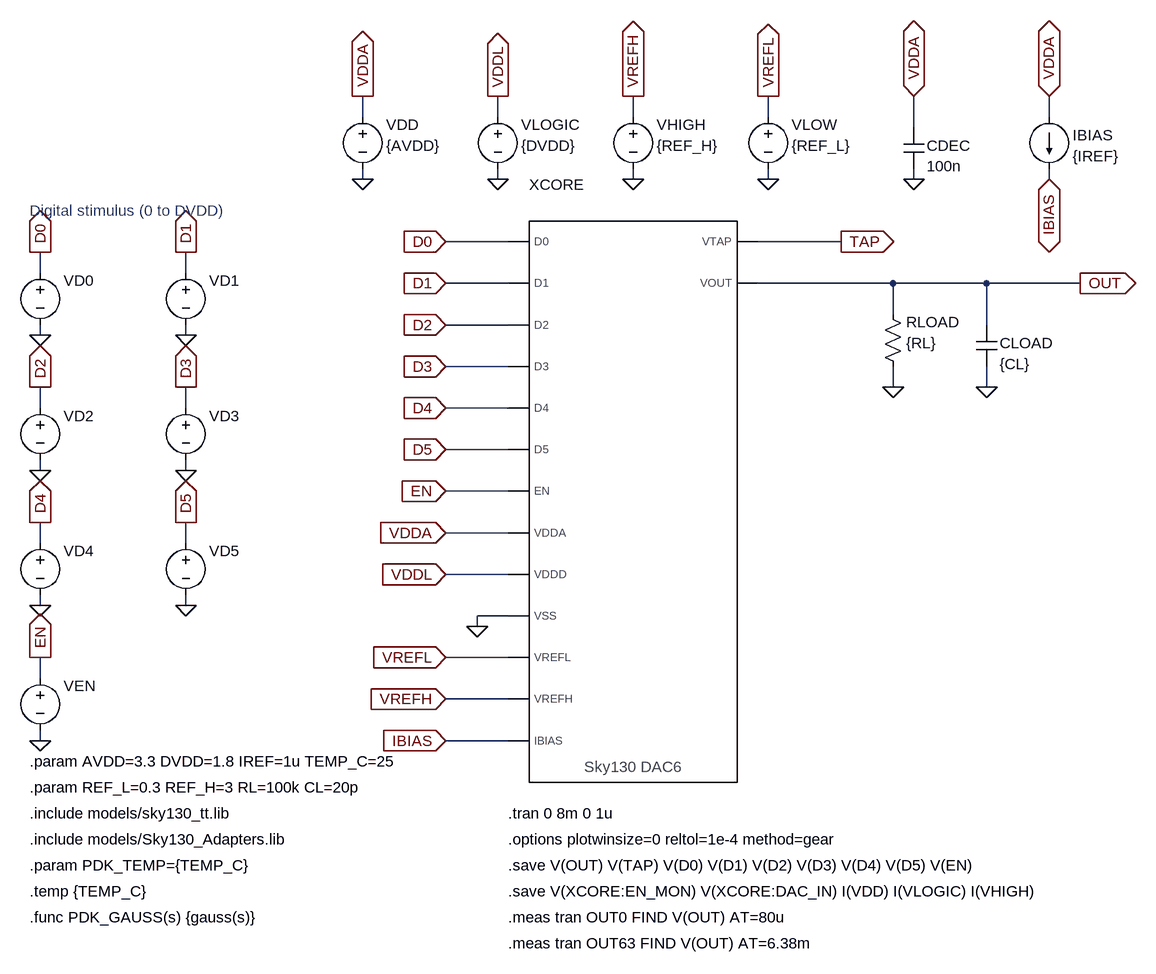
[diagram p0: schematic DAC6_Sky130_Top.asc]
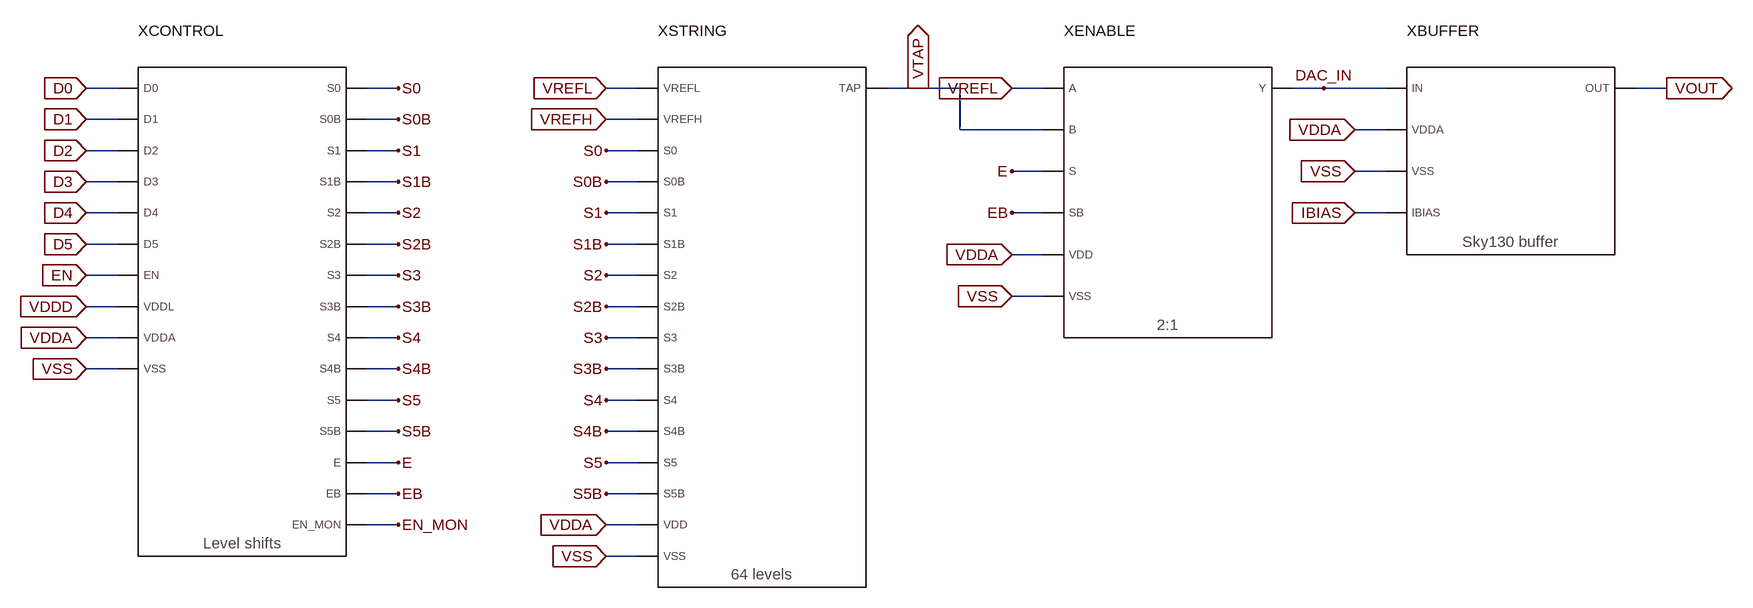
[diagram p1: sub-circuit dac6_sky130_core.asc]
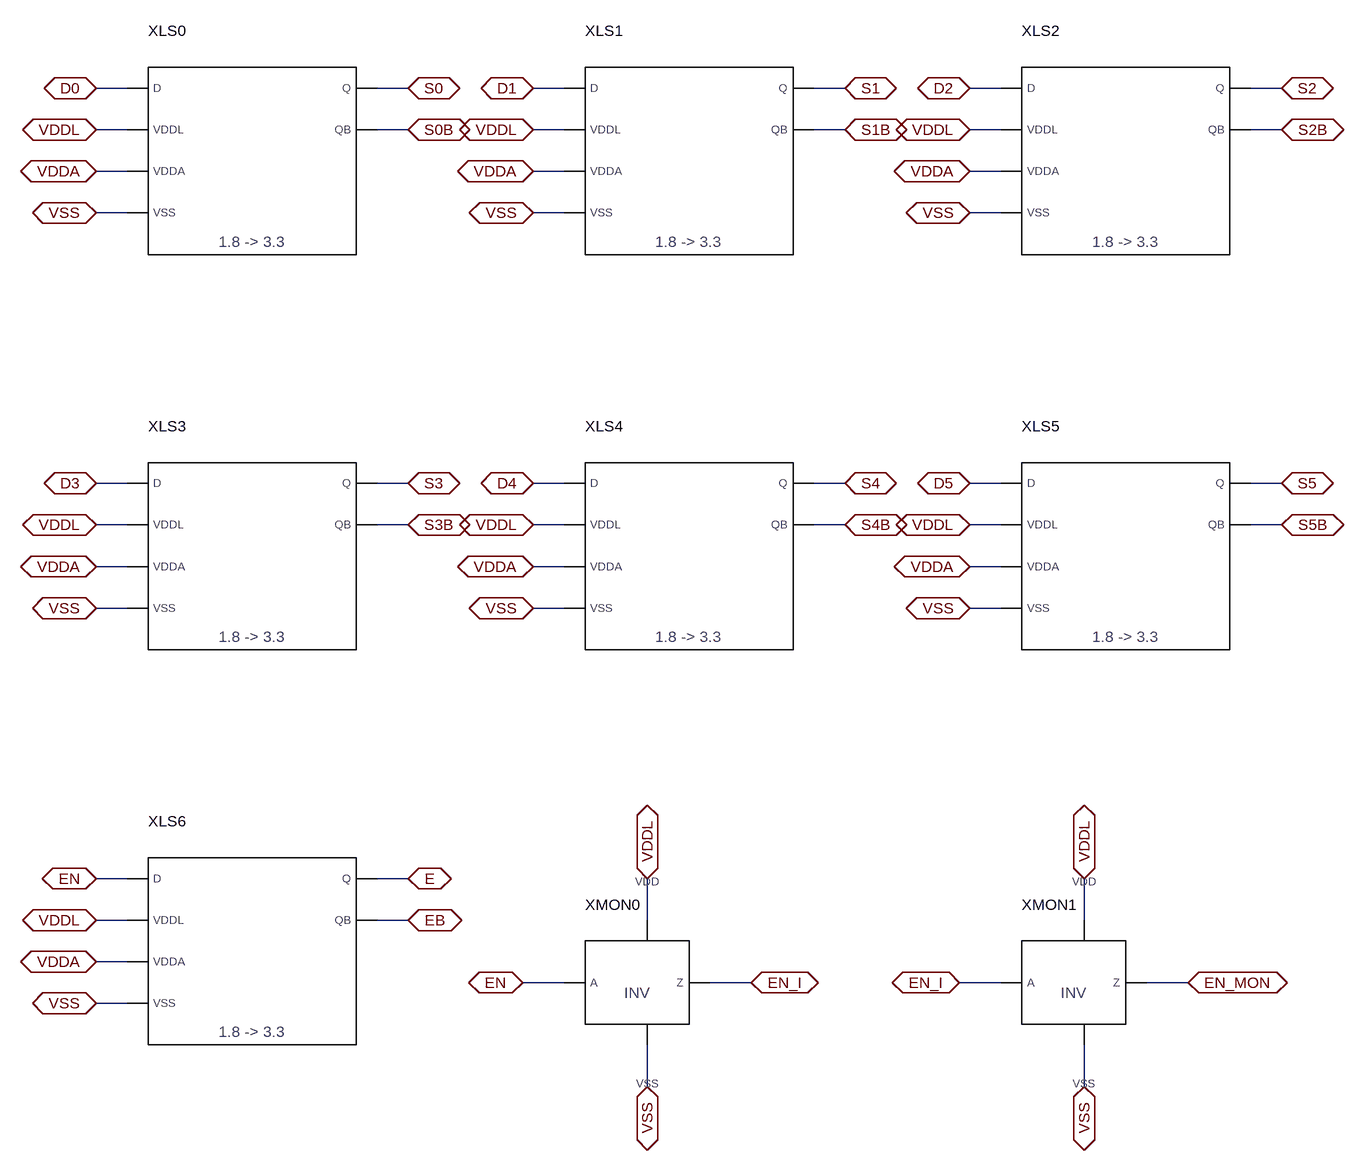
[diagram p2: sub-circuit dac_control.asc]
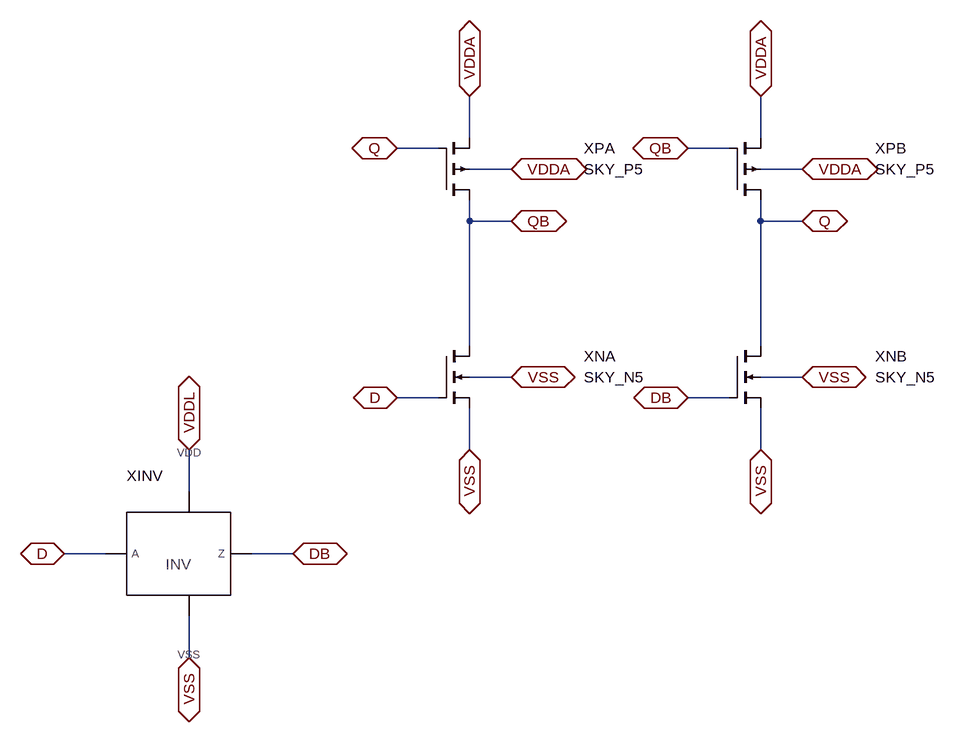
[diagram p3: sub-circuit dac_levelshift.asc]
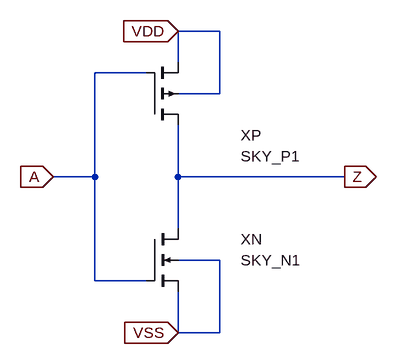
[diagram p4: sub-circuit cmos_inv.asc]
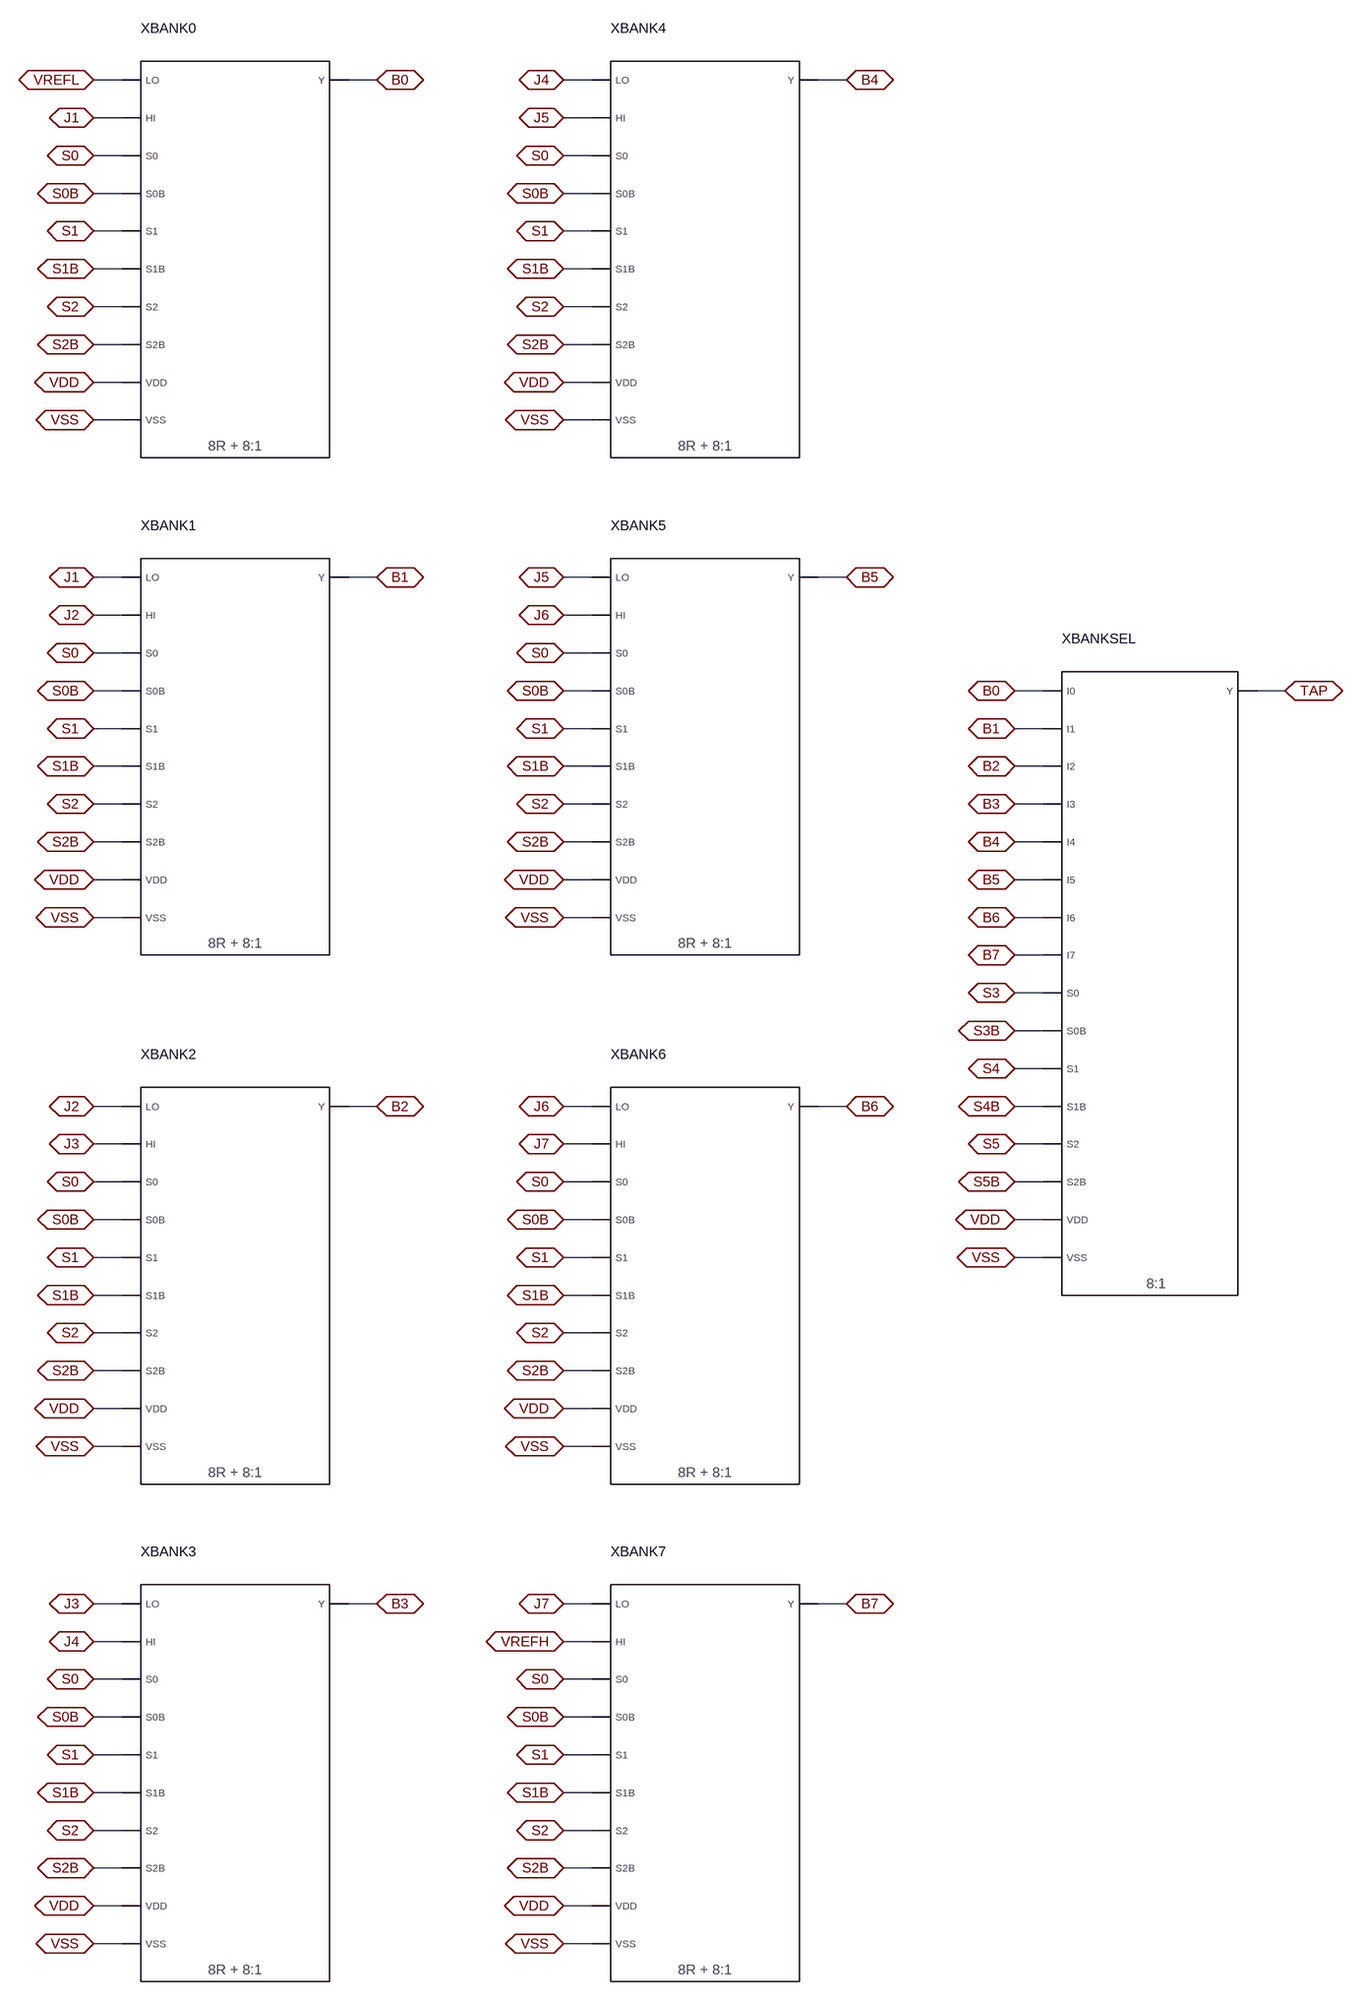
[diagram p5: sub-circuit dac_string64.asc]
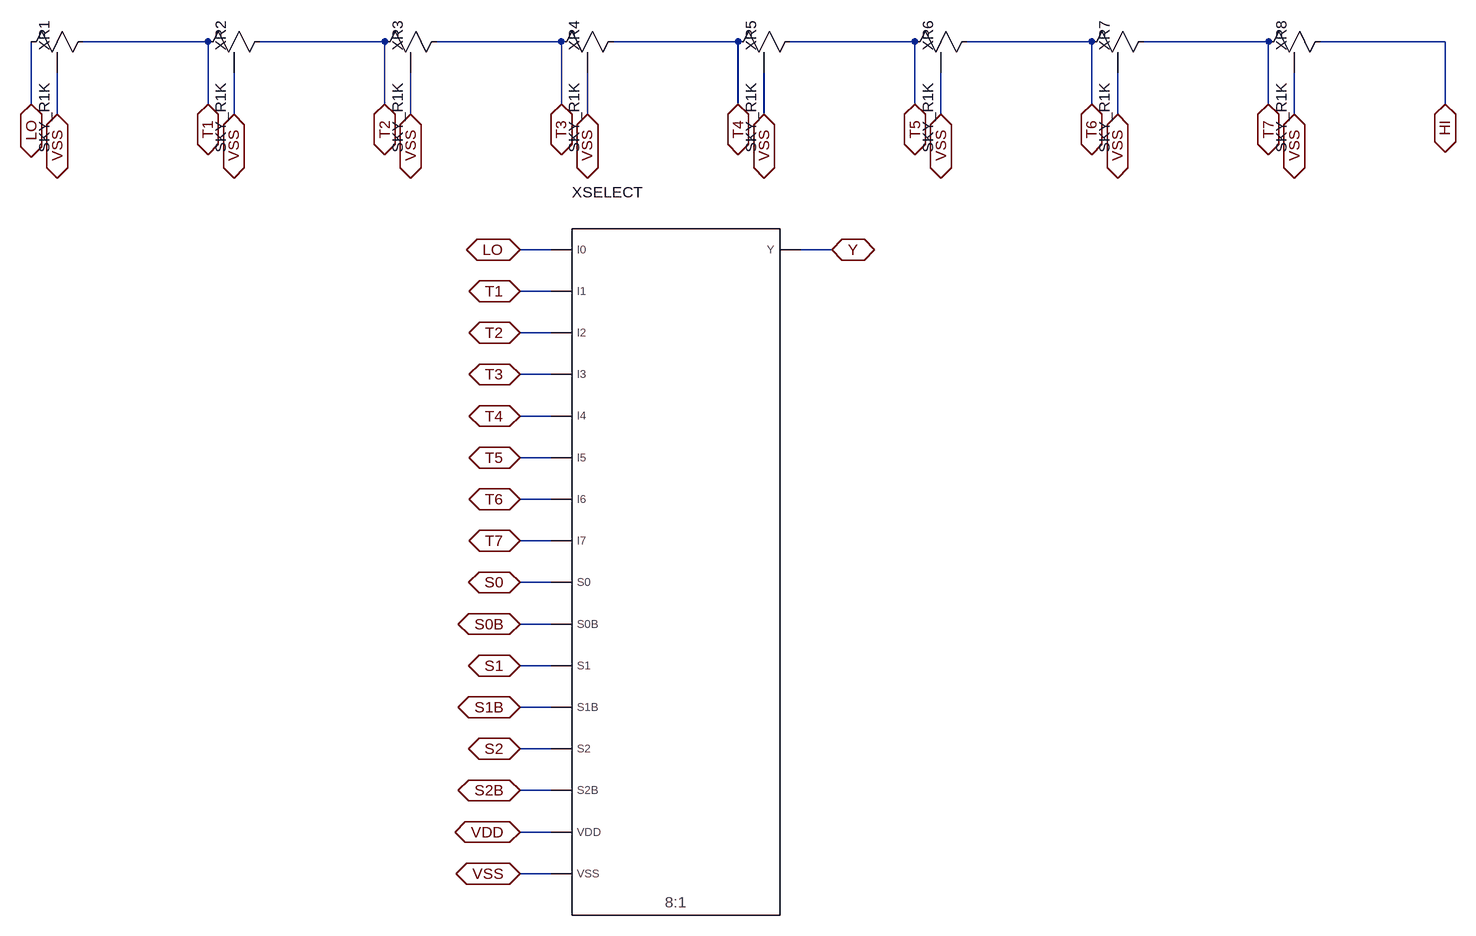
[diagram p6: sub-circuit dac_bank8.asc]
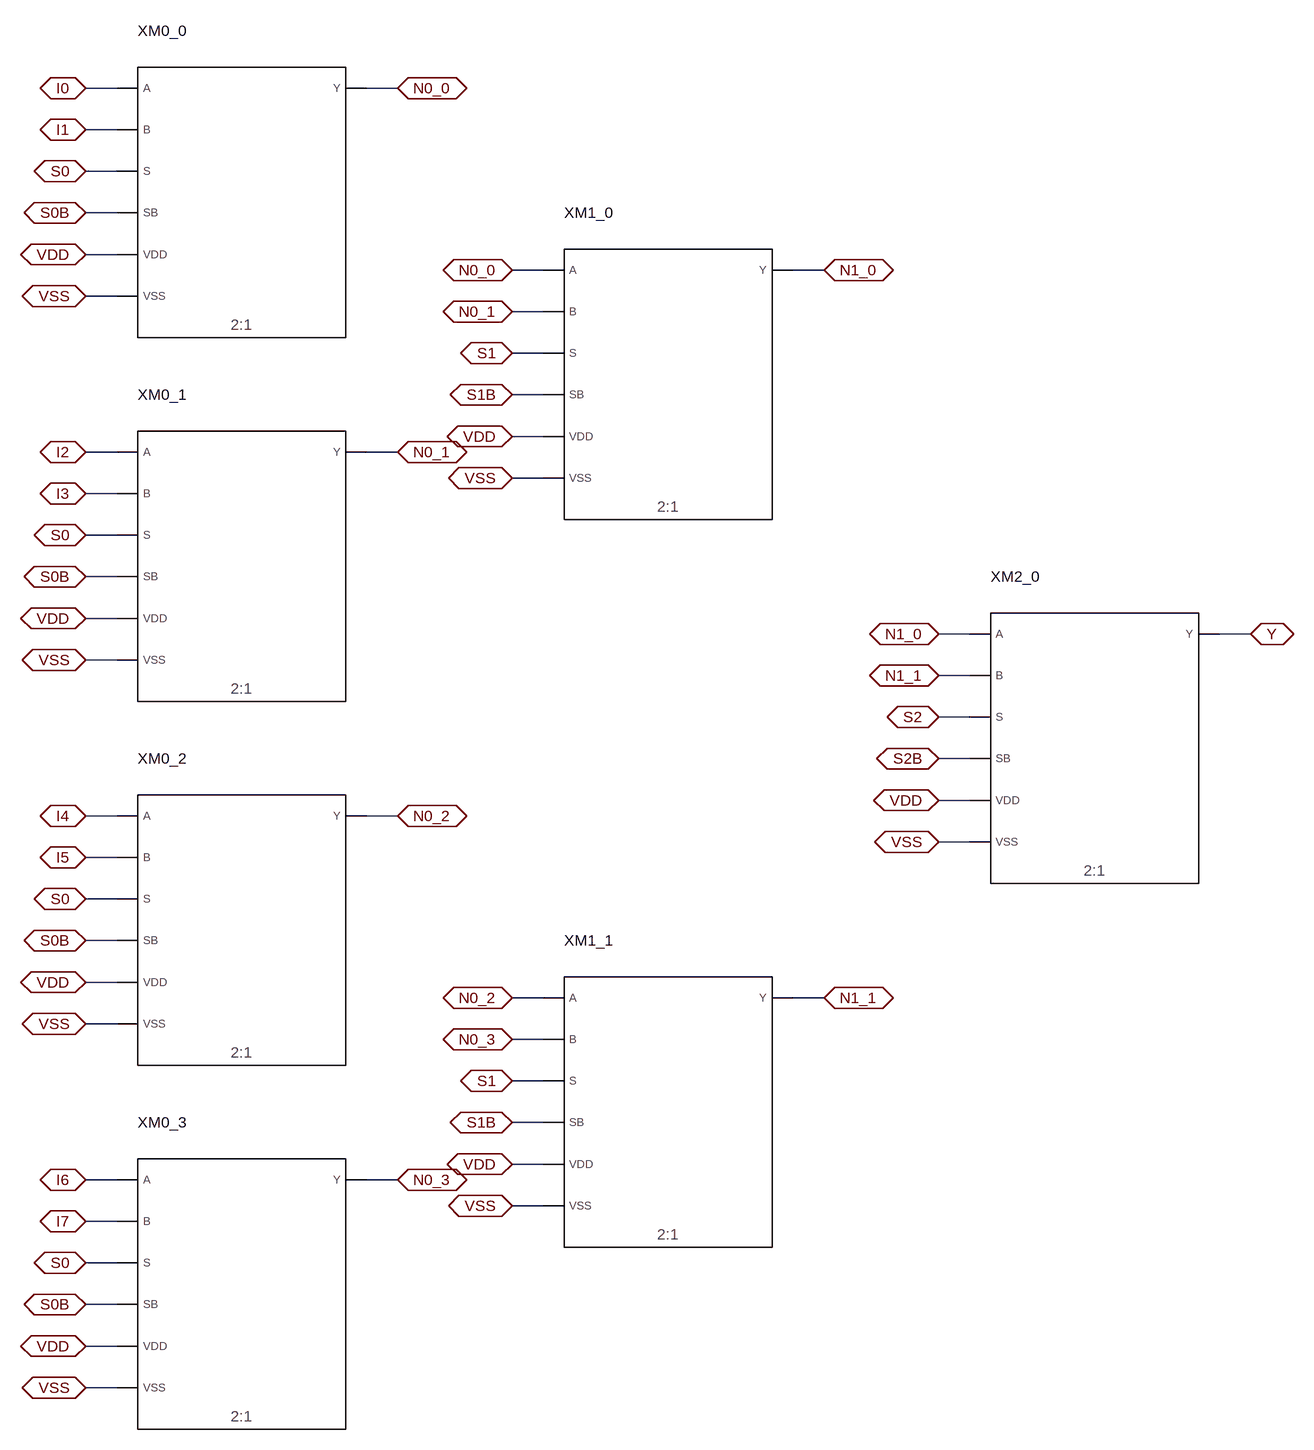
[diagram p7: sub-circuit dac_mux8.asc]
DAC6_Sky130_Top.asc, the LTspice schematic file:
Version 4.1
SHEET 1 1920 1472
WIRE 592 96 592 64
WIRE 592 192 592 176
WIRE 800 96 800 64
WIRE 800 192 800 176
WIRE 1008 96 1008 64
WIRE 1008 192 1008 176
WIRE 1216 96 1216 64
WIRE 1216 192 1216 176
WIRE 1440 112 1440 64
WIRE 1440 192 1440 176
WIRE 1648 96 1648 64
WIRE 1648 192 1648 176
WIRE 96 336 96 304
WIRE 96 432 96 416
WIRE 320 336 320 304
WIRE 320 432 320 416
WIRE 96 544 96 512
WIRE 96 640 96 624
WIRE 320 544 320 512
WIRE 320 640 320 624
WIRE 96 752 96 720
WIRE 96 848 96 832
WIRE 320 752 320 720
WIRE 320 848 320 832
WIRE 96 960 96 928
WIRE 96 1056 96 1040
WIRE 816 288 720 288
WIRE 816 352 720 352
WIRE 816 416 720 416
WIRE 816 480 720 480
WIRE 816 544 720 544
WIRE 816 608 720 608
WIRE 816 672 720 672
WIRE 816 736 720 736
WIRE 816 800 720 800
WIRE 816 864 768 864
WIRE 768 880 768 864
WIRE 816 928 720 928
WIRE 816 992 720 992
WIRE 816 1056 720 1056
WIRE 1328 288 1200 288
WIRE 1408 352 1200 352
WIRE 1552 352 1408 352
WIRE 1696 352 1552 352
WIRE 1408 400 1408 352
WIRE 1408 512 1408 480
WIRE 1552 416 1552 352
WIRE 1552 512 1552 480
FLAG 592 64 VDDA
IOPIN 592 64 Out
FLAG 592 192 0
FLAG 800 64 VDDL
IOPIN 800 64 Out
FLAG 800 192 0
FLAG 1008 64 VREFH
IOPIN 1008 64 Out
FLAG 1008 192 0
FLAG 1216 64 VREFL
IOPIN 1216 64 Out
FLAG 1216 192 0
FLAG 1440 64 VDDA
IOPIN 1440 64 BiDir
FLAG 1440 192 0
FLAG 1648 64 VDDA
IOPIN 1648 64 BiDir
FLAG 1648 192 IBIAS
IOPIN 1648 192 BiDir
FLAG 96 304 D0
IOPIN 96 304 Out
FLAG 96 432 0
FLAG 320 304 D1
IOPIN 320 304 Out
FLAG 320 432 0
FLAG 96 512 D2
IOPIN 96 512 Out
FLAG 96 640 0
FLAG 320 512 D3
IOPIN 320 512 Out
FLAG 320 640 0
FLAG 96 720 D4
IOPIN 96 720 Out
FLAG 96 848 0
FLAG 320 720 D5
IOPIN 320 720 Out
FLAG 320 848 0
FLAG 96 928 EN
IOPIN 96 928 Out
FLAG 96 1056 0
FLAG 720 288 D0
IOPIN 720 288 In
FLAG 720 352 D1
IOPIN 720 352 In
FLAG 720 416 D2
IOPIN 720 416 In
FLAG 720 480 D3
IOPIN 720 480 In
FLAG 720 544 D4
IOPIN 720 544 In
FLAG 720 608 D5
IOPIN 720 608 In
FLAG 720 672 EN
IOPIN 720 672 In
FLAG 720 736 VDDA
IOPIN 720 736 In
FLAG 720 800 VDDL
IOPIN 720 800 In
FLAG 768 880 0
FLAG 720 928 VREFL
IOPIN 720 928 In
FLAG 720 992 VREFH
IOPIN 720 992 In
FLAG 720 1056 IBIAS
IOPIN 720 1056 In
FLAG 1328 288 TAP
IOPIN 1328 288 Out
FLAG 1696 352 OUT
IOPIN 1696 352 Out
FLAG 1408 512 0
FLAG 1552 512 0
SYMBOL voltage 592 80 R0
WINDOW 0 36 28 Left 2
WINDOW 3 36 60 Left 2
SYMATTR InstName VDD
SYMATTR Value {AVDD}
SYMBOL voltage 800 80 R0
WINDOW 0 36 28 Left 2
WINDOW 3 36 60 Left 2
SYMATTR InstName VLOGIC
SYMATTR Value {DVDD}
SYMBOL voltage 1008 80 R0
WINDOW 0 36 28 Left 2
WINDOW 3 36 60 Left 2
SYMATTR InstName VHIGH
SYMATTR Value {REF_H}
SYMBOL voltage 1216 80 R0
WINDOW 0 36 28 Left 2
WINDOW 3 36 60 Left 2
SYMATTR InstName VLOW
SYMATTR Value {REF_L}
SYMBOL cap 1424 112 R0
WINDOW 0 36 28 Left 2
WINDOW 3 36 60 Left 2
SYMATTR InstName CDEC
SYMATTR Value 100n
SYMBOL current 1648 96 R0
WINDOW 0 36 28 Left 2
WINDOW 3 36 60 Left 2
SYMATTR InstName IBIAS
SYMATTR Value {IREF}
SYMBOL voltage 96 320 R0
WINDOW 0 36 28 Left 2
WINDOW 3 0 0 Invisible 0
SYMATTR InstName VD0
SYMATTR Value PWL VALUE_SCALE_FACTOR={DVDD} FILE="stimulus/d0.txt"
SYMBOL voltage 320 320 R0
WINDOW 0 36 28 Left 2
WINDOW 3 0 0 Invisible 0
SYMATTR InstName VD1
SYMATTR Value PWL VALUE_SCALE_FACTOR={DVDD} FILE="stimulus/d1.txt"
SYMBOL voltage 96 528 R0
WINDOW 0 36 28 Left 2
WINDOW 3 0 0 Invisible 0
SYMATTR InstName VD2
SYMATTR Value PWL VALUE_SCALE_FACTOR={DVDD} FILE="stimulus/d2.txt"
SYMBOL voltage 320 528 R0
WINDOW 0 36 28 Left 2
WINDOW 3 0 0 Invisible 0
SYMATTR InstName VD3
SYMATTR Value PWL VALUE_SCALE_FACTOR={DVDD} FILE="stimulus/d3.txt"
SYMBOL voltage 96 736 R0
WINDOW 0 36 28 Left 2
WINDOW 3 0 0 Invisible 0
SYMATTR InstName VD4
SYMATTR Value PWL VALUE_SCALE_FACTOR={DVDD} FILE="stimulus/d4.txt"
SYMBOL voltage 320 736 R0
WINDOW 0 36 28 Left 2
WINDOW 3 0 0 Invisible 0
SYMATTR InstName VD5
SYMATTR Value PWL VALUE_SCALE_FACTOR={DVDD} FILE="stimulus/d5.txt"
SYMBOL voltage 96 944 R0
WINDOW 0 36 28 Left 2
WINDOW 3 0 0 Invisible 0
SYMATTR InstName VEN
SYMATTR Value PWL VALUE_SCALE_FACTOR={DVDD} FILE="stimulus/enable.txt"
SYMBOL blocks\\DAC6_Sky130_Core 816 224 R0
SYMATTR InstName XCORE
SYMBOL res 1392 384 R0
WINDOW 0 36 28 Left 2
WINDOW 3 36 60 Left 2
SYMATTR InstName RLOAD
SYMATTR Value {RL}
SYMBOL cap 1536 416 R0
WINDOW 0 36 28 Left 2
WINDOW 3 36 60 Left 2
SYMATTR InstName CLOAD
SYMATTR Value {CL}
TEXT 80 240 Left 2 ;Digital stimulus (0 to DVDD)
TEXT 80 1088 Left 2 !.param AVDD=3.3 DVDD=1.8 IREF=1u TEMP_C=25
TEXT 80 1128 Left 2 !.param REF_L=0.3 REF_H=3 RL=100k CL=20p
TEXT 80 1168 Left 2 !.include models/sky130_tt.lib
TEXT 80 1208 Left 2 !.include models/Sky130_Adapters.lib
TEXT 80 1248 Left 2 !.param PDK_TEMP={TEMP_C}
TEXT 80 1288 Left 2 !.temp {TEMP_C}
TEXT 80 1328 Left 2 !.func PDK_GAUSS(s) {gauss(s)}
TEXT 816 1168 Left 2 !.tran 0 8m 0 1u
TEXT 816 1208 Left 2 !.options plotwinsize=0 reltol=1e-4 method=gear
TEXT 816 1248 Left 2 !.save V(OUT) V(TAP) V(D0) V(D1) V(D2) V(D3) V(D4) V(D5) V(EN)
TEXT 816 1288 Left 2 !.save V(XCORE:EN_MON) V(XCORE:DAC_IN) I(VDD) I(VLOGIC) I(VHIGH)
TEXT 816 1328 Left 2 !.meas tran OUT0 FIND V(OUT) AT=80u
TEXT 816 1368 Left 2 !.meas tran OUT63 FIND V(OUT) AT=6.38m

The netlist it stands for:
* DAC6_Sky130_Top.asc
VDD VDDA 0 {AVDD}
VLOGIC VDDL 0 {DVDD}
VHIGH VREFH 0 {REF_H}
VLOW VREFL 0 {REF_L}
CDEC VDDA 0 100n
IBIAS VDDA IBIAS {IREF}
VD0 D0 0 PWL VALUE_SCALE_FACTOR={DVDD} FILE="stimulus/d0.txt"
VD1 D1 0 PWL VALUE_SCALE_FACTOR={DVDD} FILE="stimulus/d1.txt"
VD2 D2 0 PWL VALUE_SCALE_FACTOR={DVDD} FILE="stimulus/d2.txt"
VD3 D3 0 PWL VALUE_SCALE_FACTOR={DVDD} FILE="stimulus/d3.txt"
VD4 D4 0 PWL VALUE_SCALE_FACTOR={DVDD} FILE="stimulus/d4.txt"
VD5 D5 0 PWL VALUE_SCALE_FACTOR={DVDD} FILE="stimulus/d5.txt"
VEN EN 0 PWL VALUE_SCALE_FACTOR={DVDD} FILE="stimulus/enable.txt"
X§XCORE D0 D1 D2 D3 D4 D5 EN VDDA VDDL 0 VREFL VREFH IBIAS TAP OUT dac6_sky130_core
RLOAD OUT 0 {RL}
CLOAD OUT 0 {CL}

* block symbol definitions
.subckt dac6_sky130_core D0 D1 D2 D3 D4 D5 EN VDDA VDDD VSS VREFL VREFH IBIAS VTAP VOUT
X§XCONTROL D0 D1 D2 D3 D4 D5 EN VDDD VDDA VSS S0 S0B S1 S1B S2 S2B S3 S3B S4 S4B S5 S5B E EB EN_MON dac_control
X§XSTRING VREFL VREFH S0 S0B S1 S1B S2 S2B S3 S3B S4 S4B S5 S5B VDDA VSS VTAP dac_string64
X§XENABLE VREFL VTAP E EB VDDA VSS DAC_IN dac_mux2
X§XBUFFER DAC_IN VDDA VSS IBIAS VOUT dac_buffer
.ends dac6_sky130_core

.subckt dac_control D0 D1 D2 D3 D4 D5 EN VDDL VDDA VSS S0 S0B S1 S1B S2 S2B S3 S3B S4 S4B S5 S5B E EB EN_MON
X§XLS0 D0 VDDL VDDA VSS S0 S0B dac_levelshift
X§XLS1 D1 VDDL VDDA VSS S1 S1B dac_levelshift
X§XLS2 D2 VDDL VDDA VSS S2 S2B dac_levelshift
X§XLS3 D3 VDDL VDDA VSS S3 S3B dac_levelshift
X§XLS4 D4 VDDL VDDA VSS S4 S4B dac_levelshift
X§XLS5 D5 VDDL VDDA VSS S5 S5B dac_levelshift
X§XLS6 EN VDDL VDDA VSS E EB dac_levelshift
X§XMON0 EN EN_I VDDL VSS cmos_inv
X§XMON1 EN_I EN_MON VDDL VSS cmos_inv
.ends dac_control

.subckt dac_levelshift D VDDL VDDA VSS Q QB
X§XINV D DB VDDL VSS cmos_inv
X§XPA QB Q VDDA VDDA SKY_P5 w=1 l=1 mult=1  ; pins D G S B
X§XNA QB D VSS VSS SKY_N5 w=7 l=0.5 mult=4  ; pins D G S B
X§XPB Q QB VDDA VDDA SKY_P5 w=1 l=1 mult=1  ; pins D G S B
X§XNB Q DB VSS VSS SKY_N5 w=7 l=0.5 mult=4  ; pins D G S B
.ends dac_levelshift

.subckt cmos_inv A Z VDD VSS
X§XP Z A VDD VDD SKY_P1 w=1 l=0.15 mult=2  ; pins D G S B
X§XN Z A VSS VSS SKY_N1 w=1 l=0.15 mult=1  ; pins D G S B
.ends cmos_inv

.subckt dac_string64 VREFL VREFH S0 S0B S1 S1B S2 S2B S3 S3B S4 S4B S5 S5B VDD VSS TAP
X§XBANK0 VREFL J1 S0 S0B S1 S1B S2 S2B VDD VSS B0 dac_bank8
X§XBANK1 J1 J2 S0 S0B S1 S1B S2 S2B VDD VSS B1 dac_bank8
X§XBANK2 J2 J3 S0 S0B S1 S1B S2 S2B VDD VSS B2 dac_bank8
X§XBANK3 J3 J4 S0 S0B S1 S1B S2 S2B VDD VSS B3 dac_bank8
X§XBANK4 J4 J5 S0 S0B S1 S1B S2 S2B VDD VSS B4 dac_bank8
X§XBANK5 J5 J6 S0 S0B S1 S1B S2 S2B VDD VSS B5 dac_bank8
X§XBANK6 J6 J7 S0 S0B S1 S1B S2 S2B VDD VSS B6 dac_bank8
X§XBANK7 J7 VREFH S0 S0B S1 S1B S2 S2B VDD VSS B7 dac_bank8
X§XBANKSEL B0 B1 B2 B3 B4 B5 B6 B7 S3 S3B S4 S4B S5 S5B VDD VSS TAP dac_mux8
.ends dac_string64

.subckt dac_bank8 LO HI S0 S0B S1 S1B S2 S2B VDD VSS Y
X§XR1 T1 LO VSS SKY_R1K  ; pins A B SUB
X§XR2 T2 T1 VSS SKY_R1K  ; pins A B SUB
X§XR3 T3 T2 VSS SKY_R1K  ; pins A B SUB
X§XR4 T4 T3 VSS SKY_R1K  ; pins A B SUB
X§XR5 T5 T4 VSS SKY_R1K  ; pins A B SUB
X§XR6 T6 T5 VSS SKY_R1K  ; pins A B SUB
X§XR7 T7 T6 VSS SKY_R1K  ; pins A B SUB
X§XR8 HI T7 VSS SKY_R1K  ; pins A B SUB
X§XSELECT LO T1 T2 T3 T4 T5 T6 T7 S0 S0B S1 S1B S2 S2B VDD VSS Y dac_mux8
.ends dac_bank8

.subckt dac_mux8 I0 I1 I2 I3 I4 I5 I6 I7 S0 S0B S1 S1B S2 S2B VDD VSS Y
X§XM0_0 I0 I1 S0 S0B VDD VSS N0_0 dac_mux2
X§XM0_1 I2 I3 S0 S0B VDD VSS N0_1 dac_mux2
X§XM0_2 I4 I5 S0 S0B VDD VSS N0_2 dac_mux2
X§XM0_3 I6 I7 S0 S0B VDD VSS N0_3 dac_mux2
X§XM1_0 N0_0 N0_1 S1 S1B VDD VSS N1_0 dac_mux2
X§XM1_1 N0_2 N0_3 S1 S1B VDD VSS N1_1 dac_mux2
X§XM2_0 N1_0 N1_1 S2 S2B VDD VSS Y dac_mux2
.ends dac_mux8

.subckt dac_mux2 A B S SB VDD VSS Y
X§XTG0 A Y SB S VDD VSS cmos_tg
X§XTG1 B Y S SB VDD VSS cmos_tg
.ends dac_mux2

.subckt cmos_tg IN OUT EN ENB VDD VSS
X§XN OUT EN IN VSS SKY_N5 w=7 l=0.5 mult=4  ; pins D G S B
X§XP OUT ENB IN VDD SKY_P5 w=7 l=0.5 mult=8  ; pins D G S B
.ends cmos_tg

.subckt dac_buffer IN VDDA VSS IBIAS OUT
X§XOTA IN OUT VDDA VSS IBIAS OUT sky_ota
.ends dac_buffer

.subckt sky_ota INP INM VDD VSS IBIAS OUT
X§XBIAS VDD VSS IBIAS BP sky_bias
X§XPIN INP INM VDD VSS BP G2 sky_inputp
X§XNIN INP INM VDD VSS IBIAS G2 sky_inputn
X§XOUTPUT G2 BP VDD VSS OUT sky_output
.ends sky_ota

.subckt sky_bias VDD VSS IBIAS BP
X§XNREF IBIAS IBIAS VSS VSS SKY_N5 w=7 l=4 mult=1  ; pins D G S B
X§XNBIAS BP IBIAS VSS VSS SKY_N5 w=7 l=4 mult=1  ; pins D G S B
X§XPREF BP BP VDD VDD SKY_P5 w=7 l=4 mult=1  ; pins D G S B
* 7/4 x1
* 7/4 x1
* 7/4 x1
.ends sky_bias

.subckt sky_inputp INP INM VDD VSS BP G2
X§XPTAIL SP BP VDD VDD SKY_P5 w=7 l=4 mult=10  ; pins D G S B
X§XPPLUS PA INP SP VDD SKY_P5 w=7 l=2 mult=32  ; pins D G S B
X§XPMINUS PB INM SP VDD SKY_P5 w=7 l=2 mult=32  ; pins D G S B
X§XNPA PA PA VSS VSS SKY_N5 w=7 l=8 mult=16  ; pins D G S B
X§XNPAX PAA PA VSS VSS SKY_N5 w=7 l=8 mult=16  ; pins D G S B
X§XPPAA PAA PAA VDD VDD SKY_P5 w=7 l=8 mult=32  ; pins D G S B
X§XPPAX G2 PAA VDD VDD SKY_P5 w=7 l=8 mult=30  ; pins D G S B
X§XNPB PB PB VSS VSS SKY_N5 w=7 l=8 mult=16  ; pins D G S B
X§XNPBX G2 PB VSS VSS SKY_N5 w=7 l=8 mult=16  ; pins D G S B
* 7/4 x10
* 7/2 x32
* 7/2 x32
* 7/8 x16
* 7/8 x16
* 7/8 x32
* 7/8 x30
* 7/8 x16
* 7/8 x16
.ends sky_inputp

.subckt sky_inputn INP INM VDD VSS IBIAS G2
X§XNTAIL SN IBIAS VSS VSS SKY_N5 w=7 l=4 mult=10  ; pins D G S B
X§XNPLUS NA INP SN VSS SKY_N5 w=7 l=2 mult=16  ; pins D G S B
X§XNMINUS NB INM SN VSS SKY_N5 w=7 l=2 mult=16  ; pins D G S B
X§XPNA NA NA VDD VDD SKY_P5 w=7 l=8 mult=32  ; pins D G S B
X§XPNAX NAA NA VDD VDD SKY_P5 w=7 l=8 mult=32  ; pins D G S B
X§XNNAA NAA NAA VSS VSS SKY_N5 w=7 l=8 mult=16  ; pins D G S B
X§XNNAX G2 NAA VSS VSS SKY_N5 w=7 l=8 mult=16  ; pins D G S B
X§XPNB NB NB VDD VDD SKY_P5 w=7 l=8 mult=32  ; pins D G S B
X§XPNBX G2 NB VDD VDD SKY_P5 w=7 l=8 mult=32  ; pins D G S B
* 7/4 x10
* 7/2 x16
* 7/2 x16
* 7/8 x32
* 7/8 x32
* 7/8 x16
* 7/8 x16
* 7/8 x32
* 7/8 x32
.ends sky_inputn

.subckt sky_output G2 BP VDD VSS OUT
X§XPOUT OUT BP VDD VDD SKY_P5 w=7 l=4 mult=100  ; pins D G S B
X§XNOUT OUT G2 VSS VSS SKY_N5 w=7 l=1 mult=10  ; pins D G S B
X§XRC N001 G2 VSS SKY_R l=2.2  ; pins A B SUB
X§XCC N001 OUT SKY_C w=173.0 l=173.0  ; pins A B
* 7/4 x100
* 7/1 x10
* L=2.2 um (~1.5k)
* 173 um square (~60p)
.ends sky_output

* Digital stimulus (0 to DVDD)
.param AVDD=3.3 DVDD=1.8 IREF=1u TEMP_C=25
.param REF_L=0.3 REF_H=3 RL=100k CL=20p
.include models/sky130_tt.lib
.include models/Sky130_Adapters.lib
.param PDK_TEMP={TEMP_C}
.temp {TEMP_C}
.func PDK_GAUSS(s) {gauss(s)}
.tran 0 8m 0 1u
.options plotwinsize=0 reltol=1e-4 method=gear
.save V(OUT) V(TAP) V(D0) V(D1) V(D2) V(D3) V(D4) V(D5) V(EN)
.save V(XCORE:EN_MON) V(XCORE:DAC_IN) I(VDD) I(VLOGIC) I(VHIGH)
.meas tran OUT0 FIND V(OUT) AT=80u
.meas tran OUT63 FIND V(OUT) AT=6.38m
.backanno
.end